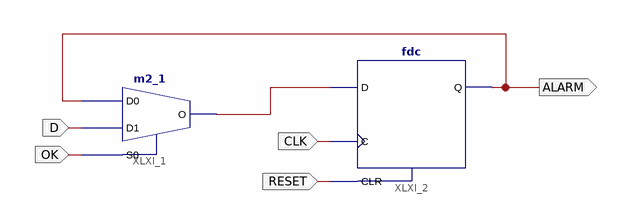
[diagram p0: schematic sheet 1]
// Xilinx ISE schematic Alarme.sch (spartan3e) as structural Verilog: 2 symbols, 5 ports
module Alarme (
  input  D,
  input  CLK,
  input  RESET,
  input  OK,
  output ALARM
);

  wire XLXN_2;

  m2_1 XLXI_1 (.D0(ALARM), .D1(D), .S0(OK), .O(XLXN_2));
  fdc XLXI_2 (.C(CLK), .CLR(RESET), .D(XLXN_2), .Q(ALARM));
endmodule
